# Altium schematic sheet Power.SchDoc
size 431 x 279 mm; SheetNumber: 4; SheetTotal: 7
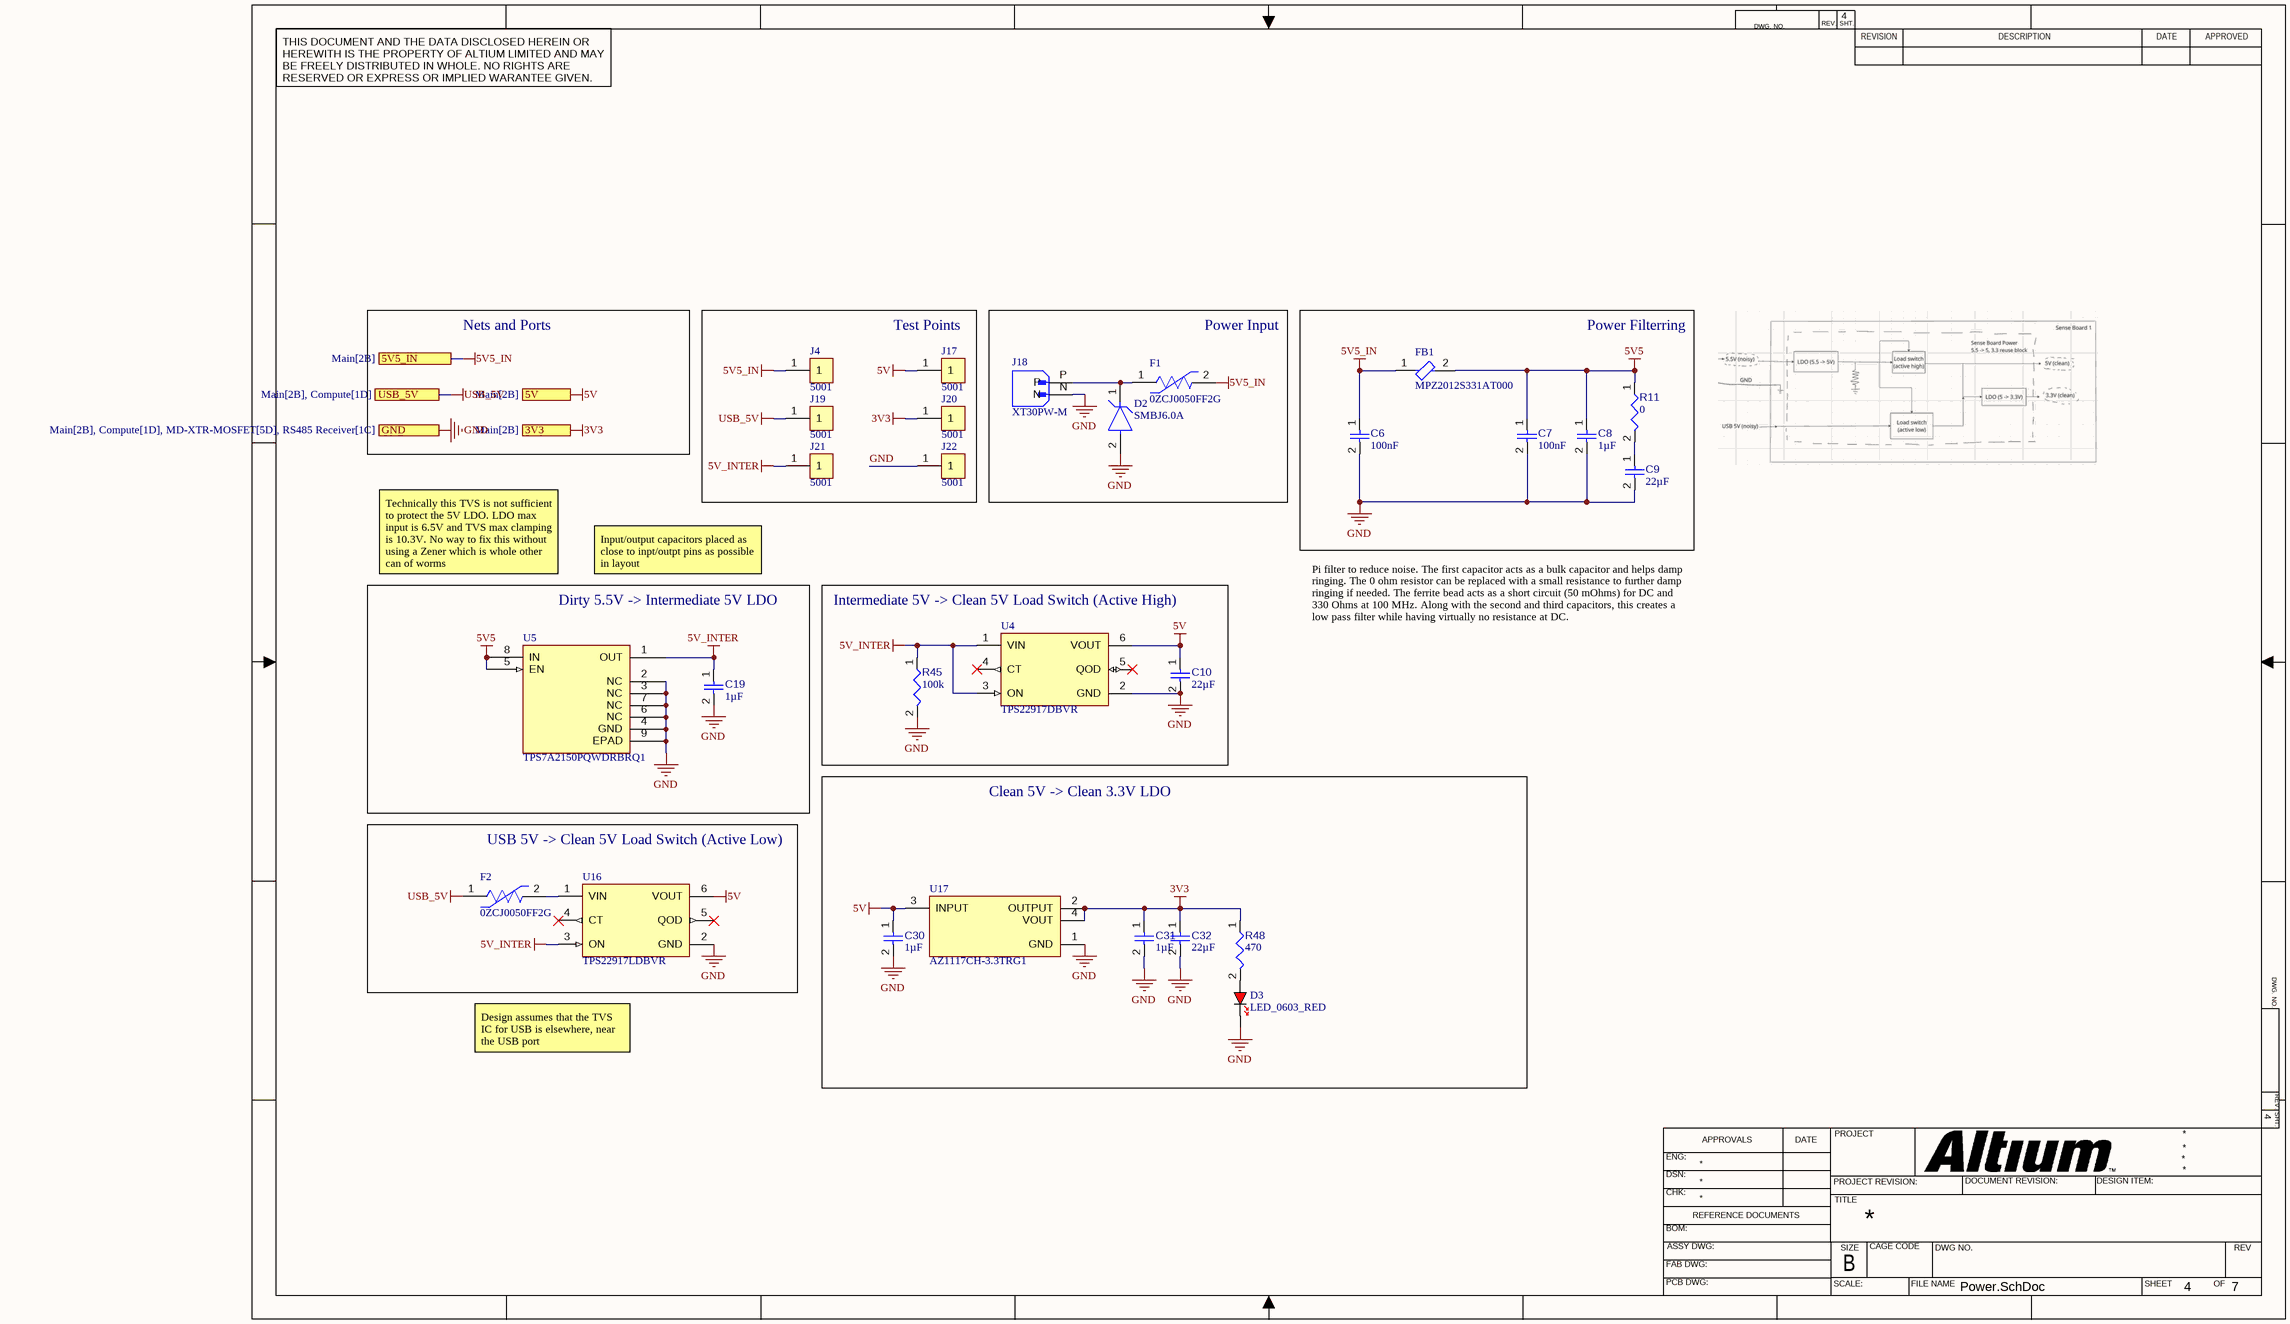
[diagram p0: Power.SchDoc]

## Parts
C6  value 100nF  [CAPC1608X90X40NL10T20]  (hidden comment: Capacitor 100 nF +/-10% 50 V 0603)
C7  value 100nF  [CAPC1608X90X40NL10T20]  (hidden comment: Capacitor 100 nF +/-10% 50 V 0603)
C8  value 1µF  [CAPC1608X94X35NL15T15]  (hidden comment: Capacitor 1 uF +/- 10% 16 V 0603)
C9  value 22µF  [CAPC0805(2012)145_L]  (hidden comment: Capacitor 22µF +/-40% 16V 0805)
C10  value 22µF  [CAPC0805(2012)145_L]  (hidden comment: Capacitor 22µF +/-40% 16V 0805)
C19  value 1µF  [CAPC0603(1608)100_L]  (hidden comment: Capacitor 1µF +/-40% 50V 0603)
C30  value 1µF  [CAPC0603(1608)100_L]  (hidden comment: Capacitor 1µF +/-40% 50V 0603)
C31  value 1µF  [CAPC0603(1608)100_L]  (hidden comment: Capacitor 1µF +/-40% 50V 0603)
C32  value 22µF  [CAPC0805(2012)145_L]  (hidden comment: Capacitor 22µF +/-40% 16V 0805)
D2  SMBJ6.0A  [FP-SMBJ-MFG]
D3  LED_0603_RED  [LED_0603_RED]
F1  0ZCJ0050FF2G  [FP-0ZCJ0050FF2G-MFG]
F2  0ZCJ0050FF2G  [FP-0ZCJ0050FF2G-MFG]
FB1  MPZ2012S331AT000  [FP-MPZ2012-IPC_A]
J4  5001  [FP-5001-MFG]
J17  5001  [FP-5001-MFG]
J18  XT30PW-M  [AMASS_XT30PW-M]
J19  5001  [FP-5001-MFG]
J20  5001  [FP-5001-MFG]
J21  5001  [FP-5001-MFG]
J22  5001  [FP-5001-MFG]
R11  value 0  [RESC0603(1608)_L]  (hidden comment: 0R3J)
R45  value 100k  [RESC1608X55X25NL10T15]  (hidden comment: Resistor 100k +/-1% 0603 100 mW)
R48  value 470  [RESC1608X55X25NL10T15]  (hidden comment: Resistor 470R +/-1% 0603 100 mW)
U4  TPS22917DBVR  [FP-DBV0006A-IPC_A]
U5  TPS7A2150PQWDRBRQ1  [SON65P300X100_HS-9N]
U16  TPS22917LDBVR  [FP-DBV0006A-IPC_B]
U17  AZ1117CH-3.3TRG1  [FP-SOT223-IPC_B]

## Blocks framed on the sheet
Test Points: J4 J17 J19-J22
Power Input: D2 F1 J18
Power Filterring: C6-C9 FB1 R11
Dirty 5.5V -> Intermediate 5V LDO: C19 U5
Intermediate 5V -> Clean 5V Load Switch (Active High): C10 R45 U4
Clean 5V -> Clean 3.3V LDO: C30-C32 D3 R48 U17
USB 5V -> Clean 5V Load Switch (Active Low): F2 U16

## Ports
3V3 (see Main[2B]), 5V5_IN (see Main[2B]), 5V (see Main[2B]), GND (see Main[2B], Compute[1D], MD-XTR-MOSFET[5D], RS485 Receiver[1C]), USB_5V (see Main[2B], Compute[1D])

## Nets
3V3: C31.1 C32.1 J20.1 R48.1 U17.2(OUTPUT) U17.4(VOUT) ; port 3V3
5V: C10.1 C30.1 J17.1 U4.6(VOUT) U16.6(VOUT) U17.3(INPUT) ; port 5V
5V5: C7.1 C8.1 FB1.2 R11.1 U5.5(EN) U5.8(IN)
5V5_IN: C6.1 F1.2 FB1.1 J4.1 ; port 5V5_IN
5V_INTER: C19.1 J21.1 R45.1 U4.1(VIN) U4.3(ON) U5.1(OUT) U16.3(ON)
GND: C6.2 C7.2 C8.2 C9.2 C10.2 C19.2 C30.2 C31.2 C32.2 D2.2(A) D3.K J18.N J22.1 R45.2 U4.2(GND) U5.2(NC) U5.3(NC) U5.4(GND) U5.6(NC) U5.7(NC) U5.9(EPAD) U16.2(GND) U17.1(GND) ; port GND
USB_5V: F2.1 J19.1 ; port USB_5V
NetC9_1: C9.1 R11.2
NetD2_1: D2.1(C) F1.1 J18.P
NetD3_A: D3.A R48.2
NetF2_2: F2.2 U16.1(VIN)

Not connected (* = marked no-connect by the designer): U4 4(CT)* 5(QOD)*; U16 4(CT)* 5(QOD)*

## Notes on the sheet
- Nets and Ports
- Technically this TVS is not sufficient to protect the 5V LDO. LDO max input is 6.5V and TVS max clamping is 10.3V. No way to fix this without using a Zener which is whole other can of worms
- Input/output capacitors placed as close to inpt/outpt pins as possible in layout
- Pi filter to reduce noise. The first capacitor acts as a bulk capacitor and helps damp ringing. The 0 ohm resistor can be replaced with a small resistance to further damp ringing if needed. The ferrite bead acts as a short circuit (50 mOhms) for DC and 330 Ohms at 100 MHz. Along with the second and third capacitors, this creates a low pass filter while having virtually no resistance at DC.
- Design assumes that the TVS IC for USB is elsewhere, near the USB port
- DWG. NO.
- REV.
- SHT.
- THIS DOCUMENT AND THE DATA DISCLOSED HEREIN OR HEREWITH IS THE PROPERTY OF ALTIUM LIMITED AND MAY BE FREELY DISTRIBUTED IN WHOLE. NO RIGHTS ARE RESERVED OR EXPRESS OR IMPLIED WARANTEE GIVEN.
- REVISION
- DESCRIPTION
- DATE
- APPROVED
- ENG:
- APPROVALS
- PROJECT
- DSN:
- CHK:
- REFERENCE DOCUMENTS
- PROJECT REVISION:
- TITLE
- DOCUMENT REVISION:
- DESIGN ITEM:
- BOM:
- FAB DWG:
- PCB DWG:
- ASSY DWG:
- SCALE:
- SIZE
- B
- CAGE CODE
- FILE NAME
- DWG NO.
- SHEET
- OF
- REV

## Library data of the parts
C6 C7 = CMP-001-00017-6: Chip Capacitor, 100 nF, +/- 10%, 50 V, 0603 (1608 Metric); Voltage Rating: 50V; Capacitor Type: Ceramic; Tolerance: 10%; Mounting Technology: SM; Max Operating Temperature: 125°C; RoHS Compliant: True; Pins: 2; Case/Package: 0603; Min Operating Temperature: -55°C
C8 = CMP-001-00003-6: Chip Capacitor, 1 uF, +/- 10%, 16 V, 0603 (1608 Metric); Voltage Rating: 16V; Capacitor Type: Ceramic; Max Operating Temperature: 125°C; Pins: 2; Tolerance: 10%; Min Operating Temperature: -55°C; RoHS Compliant: True; Mounting Technology: SM; Case/Package: 0603
C9 C10 C32 = CMP-001-00081-4: Chip Capacitor, 22µF +/-40%, 16V, 0805, Thickness 1.45 mm; Tolerance: 5%; Voltage Rating: 16V; Mounting Technology: SMT; Pins: 2; Max Operating Temperature: 85°C; Case/Package: 0805; Min Operating Temperature: -55°C
C19 C30 C31 = CMP-001-00078-4: Chip Capacitor, 1µF +/-40%, 50V, 0603, Thickness 1 mm; Tolerance: 10%; Case/Package: 0603; Pins: 2; Max Operating Temperature: 85°C; Voltage Rating: 50V; Mounting Technology: SMT; Min Operating Temperature: -55°C
D2 = CMP-00013-1: TVS Diode, 6V Standoff, 600W, 60V V(RWM), Unidirectional, 1 Element, Silicon, DO-214AA; Min Breakdown Voltage: 66.7V; Diode Type: TRANS VOLTAGE SUPPRESSOR; Number of Elements: 1; Max Breakdown Voltage: 10.3V; Reverse Standoff Voltage: 6.0V; Max Operating Temperature: 150°C; Polarity: Unidirectional; Diode Element Material: SILICON; JESD-30 Code: R-PDSO-C2; JESD-609 Code: e3; Rep Pk Reverse Voltage-Max: 60V; Mounting Technology: SMT; Non-rep Peak Rev Power Dis-Max: 600W; JEDEC-95 Code: DO-214AA; RoHS Compliant: Yes; Moisture Sensitivity Level: 1; Min Operating Temperature: -65°C; Pins: 2; Case/Package: DO-214AA; Peak Reflow Temperature (Cel): 260°C
D3 = CMP-004-00058-1: LED 0603 RED SMD; Source: Schematic-Lib-PhilsLab.SchLib; Design Item ID: LED_0603_RED
F1 F2 = CMP-00012-1: PTC Resettable Fuse, 8V, 0.5A hold, 1A trip, 0.15ohm, Surface Mount; Package Width: 1.8mm; Package Length: 3.5mm; Current Rating: 100A; Package Height: 0.55mm; Reference Standard: UL; Resistor Type: PTC THERMISTOR; Terminal Finish: Tin; Min Operating Temperature: -40°C; Working Voltage: 8V; Case/Package: 1206; RoHS Compliant: Yes; Mounting Technology: SMT; Reach SVHC Compliant: Yes; Pins: 2; Max Operating Temperature: 85°C; JESD-609 Code: e3
FB1 = CMP-00024-1: Ferrite Beads, 330Ohm 25% 100MHz, 50 mOhm DC, 2.5A, 0805; DC Resistance (DCR): 50mΩ; Impedance: 330Ω; Value: 50mΩ; Min Width: 1.05mm; Max Operating Temperature: 125°C; Clock Frequency: 100MHz; Pins: 2; Case/Package: 0805; Mounting Technology: Surface Mount; Max DC Current: 2.5A; ESR: 50mΩ; RMS Current (Irms): 2.5A; Current Rating: 2.5A; Min Operating Temperature: -55°C; Tolerance: 25%; Termination: SMD/SMT; Core Material: Ferrite; RoHS: Compliant; Test Frequency: 100MHz
J4 J17 J19-J22 = CMP-2000-05181-2: PC TEST POINT MINIATURE BLACK; Body Material: Bronze; Plating: Silver; Inside Diameter: 1.27mm; Hole Diameter: 1.6mm; Number of Ports: 1; Outside Diameter: 2.54mm; Insulation: Insulated; Insulation Material: Nylon; Mount: Through Hole; RoHS Compliant: Yes; Series: THM; Height: 0.3inch; Termination: Through Hole; Material: Nylon; Packaging: Bulk; Contact Material: Bronze; REACH SVHC: No SVHC; Contact Plating: Silver; Orientation: Straight; Lead Free: Lead Free; Package Quantity: 100; Length: 7.62mm; Flammability Rating: UL94 V-0; Number of Contacts: 1; Diameter: 2.54mm; Housing Color: Black; Color: Black
J18 = CMP-002-00206-1: Socket; DC supply; XT30; male; PIN: 2; on PCBs; THT; Colour: yellow; MF: AMASS; Case/Package: None; MP: XT30PW-M; Value: *; Pins: 2; Design Item ID: XT30PW-M; Component Type: Standard; Source: XT30PW-M.SchLib; SnapEDA_Link: https://www.snapeda.com/parts/XT30PW-M/AMASS/view-part/?ref=snap; Check_prices: https://www.snapeda.com/parts/XT30PW-M/AMASS/view-part/?ref=eda
R11 = CMP-009-00063-2: Jumper 0603 (1608 Metric); Case/Package: 0603; Mounting Technology: SMT; Pins: 2
R45 = CMP-009-00023-5: Chip Resistor, 100 KOhm, +/- 1%, 0.1 W, -55 to 155 degC, 0603 (1608 Metric); Voltage Rating: 50V; Power: 100mW; Max Operating Temperature: 155°C; RoHS Compliant: True; Tolerance: 1%; Pins: 2; Case/Package: 0603; Mounting Technology: SM; Min Operating Temperature: -55°C
R48 = CMP-009-00297-1: Chip Resistor, 470 Ohm, +/-1%, 0.1 W, -55 to 155 degC, 0603 (1608 Metric); Voltage Rating: 50V; Power: 100mW; Tolerance: 1%; Case/Package: 0603; Mounting Technology: SM; RoHS Compliant: True; Max Operating Temperature: 155°C; Min Operating Temperature: -55°C; Pins: 2
U4 = CMP-04912-000029-1: IC PWR SWITCH P-CHAN 1:1 SOT23-6; Number of Outputs: 1; Output Configuration: High Side; Fault Protection: Reverse Current; Interface: On/Off; Max Output Current: 2A; Max Operating Temperature: 125°C; Case/Package: SOT-23-6; Packaging: Tape and Reel; Number of Channels: 1; Min Operating Temperature: -40°C
U5 = CMP-019-00074-10: Automotive, 500mA, low-noise ultra-low-IQ high-PSRR low-dropout (LDO) voltage regulator 8-SON -40 to 125
U16 = CMP-019-00081-3: 5.5-V, 2-A, 80-mΩ , 10-nA leakage load switch adj. rise time and adj output discharge 6-SOT-23 -45 to 125, EN Active Low; RoHS Compliant: Yes
U17 = CMP-00015-1: IC LDO, 3.3V FIXED OUTPUT, 1.3V MAX DROPOUT, 1A; Output Current1-Max: 800mA; Dropout Voltage1-Nom: 1.2V; Output Voltage1-Max: 3.365V; Regulator Type: FIXED POSITIVE SINGLE OUTPUT LDO REGULATOR; Voltage Tolerance-Max: 1.97%; Number of Outputs: 1; Package Body Material: Plastic; Qualification Status: Not Qualified; Output Voltage1-Min: 3.235V; Max Supply Voltage: 15V; Input Voltage Absolute-Max: 18V; Dropout Voltage1-Max: 1.3V; JESD-30 Code: R-PDSO-G3; Technology: BIPOLAR; Operating Temperature, TJ-Min: -20°C; Pins: 3; Adjustability: FIXED; Height - Seated (Max): 1.8mm; Length: 6.5mm; Moisture Sensitivity Level: 1; Terminal Position: DUAL; Channels: 1; Width: 3.5mm; Packaging: Tape and Reel; Output Voltage1-Nom: 3.3V; Reach SVHC Compliant: Yes; Terminal Form: Gull Wing; Operating Temperature, TJ-Max: 125°C; RoHS Compliant: Yes; Terminal Pitch: 2.3mm; Terminal Finish: Tin; Surface Mount: Yes; JESD-609 Code: e3; Case/Package: SOP; Package Shape: Rectangular